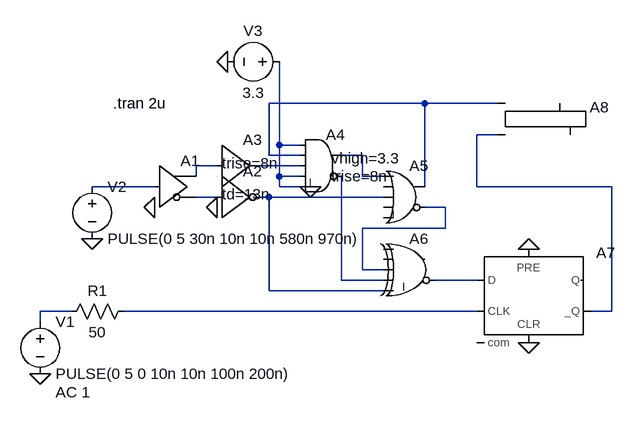
[diagram p0: schematic test_ltspice_gates.asc]
test_ltspice_gates.asc, the LTspice schematic file:
Version 4.1
SHEET 1 880 680
WIRE 544 32 304 32
WIRE 656 32 544 32
WIRE 656 80 624 80
WIRE 320 96 320 -32
WIRE 352 96 320 96
WIRE 304 112 304 32
WIRE 352 112 304 112
WIRE 448 112 416 112
WIRE 224 128 192 128
WIRE 352 128 288 128
WIRE 192 144 192 128
WIRE 320 144 320 96
WIRE 352 144 320 144
WIRE 448 144 448 112
WIRE 480 144 448 144
WIRE 128 160 32 160
WIRE 320 160 320 144
WIRE 352 160 320 160
WIRE 544 160 544 32
WIRE 624 160 624 80
WIRE 832 160 624 160
WIRE 224 176 192 176
WIRE 304 176 288 176
WIRE 480 176 304 176
WIRE 576 192 544 192
WIRE 576 224 576 192
WIRE 576 224 448 224
WIRE 448 288 448 224
WIRE 480 288 448 288
WIRE 416 304 416 144
WIRE 480 304 416 304
WIRE 624 304 560 304
WIRE 304 320 304 176
WIRE 480 320 304 320
WIRE 0 352 -48 352
WIRE 624 352 80 352
WIRE 832 352 832 160
WIRE 832 352 800 352
WIRE -48 368 -48 352
FLAG -48 448 0
FLAG 128 192 0
FLAG 368 160 0
FLAG 224 192 0
FLAG 32 240 0
FLAG 704 256 0
FLAG 704 400 0
FLAG 240 -32 0
SYMBOL Digital\\buf 128 96 R0
SYMATTR InstName A1
SYMBOL Digital\\inv 224 112 R0
WINDOW 3 8 60 Left 2
SYMATTR InstName A2
SYMATTR Value td=13n
SYMBOL Digital\\buf1 224 64 R0
WINDOW 3 8 60 Left 2
SYMATTR InstName A3
SYMATTR Value trise=8n
SYMBOL Digital\\and 384 64 R0
WINDOW 3 16 52 Left 2
WINDOW 123 16 80 Left 2
SYMATTR InstName A4
SYMATTR Value vhigh=3.3
SYMATTR Value2 trise=8n
SYMBOL Digital\\or 512 112 R0
SYMATTR InstName A5
SYMBOL Digital\\xor 528 224 R0
SYMATTR InstName A6
SYMBOL voltage -48 352 R0
WINDOW 123 24 124 Left 2
WINDOW 39 0 0 Left 0
SYMATTR InstName V1
SYMATTR Value PULSE(0 5 0 10n 10n 100n 200n)
SYMATTR Value2 AC 1
SYMBOL res 96 336 R90
WINDOW 0 0 56 VBottom 2
WINDOW 3 32 56 VTop 2
SYMATTR InstName R1
SYMATTR Value 50
SYMBOL Digital\\dflop 704 256 R0
SYMATTR InstName A7
SYMBOL voltage 32 144 R0
WINDOW 123 0 0 Left 0
WINDOW 39 0 0 Left 0
SYMATTR InstName V2
SYMATTR Value PULSE(0 5 30n 10n 10n 580n 970n)
SYMBOL Digital\\srflop 704 -16 R0
SYMATTR InstName A8
SYMBOL voltage 336 -32 R90
WINDOW 0 -32 56 VBottom 2
WINDOW 3 32 56 VTop 2
WINDOW 123 0 0 Left 0
WINDOW 39 0 0 Left 0
SYMATTR InstName V3
SYMATTR Value 3.3
TEXT 64 32 Left 2 !.tran 2u

The netlist it stands for:
* test_ltspice_gates.asc
A1 N007 0 0 0 0 N008 N005 0 BUF
A2 N008 0 0 0 0 N009 0 0 BUF td=13n
A3 N005 0 0 0 0 0 N006 0 BUF trise=8n
A4 N003 N001 N006 N003 N003 N011 N004 0 AND vhigh=3.3 trise=8n
A5 N004 0 N009 0 0 N010 N001 0 OR
A6 0 0 N010 N011 N009 N012 0 0 XOR
V1 N013 0 PULSE(0 5 0 10n 10n 100n 200n) AC 1
R1 N014 N013 50
A7 N012 0 N014 0 0 N002 0 0 DFLOP
V2 N007 0 PULSE(0 5 30n 10n 10n 580n 970n)
A8 N001 N002 0 0 0 0 0 0 SRFLOP
V3 N003 0 3.3
.tran 2u
.backanno
.end